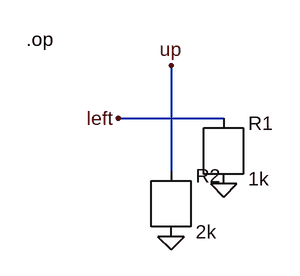
[diagram p0: schematic cross.asc]
cross.asc, the LTspice schematic file:
Version 4
SHEET 1 800 600
WIRE 128 128 256 128
WIRE 192 64 192 192
FLAG 128 128 left
FLAG 192 64 up
FLAG 256 208 0
FLAG 192 272 0
SYMBOL res 240 112 R0
SYMATTR InstName R1
SYMATTR Value 1k
SYMBOL res 176 176 R0
SYMATTR InstName R2
SYMATTR Value 2k
TEXT 16 32 Left 2 !.op

The netlist it stands for:
* cross.asc
R1 left 0 1k
R2 up 0 2k
.op
.backanno
.end